# Altium schematic sheet Controller_Sheet.SchDoc
size A; SheetNumber: 3; SheetTotal: 3
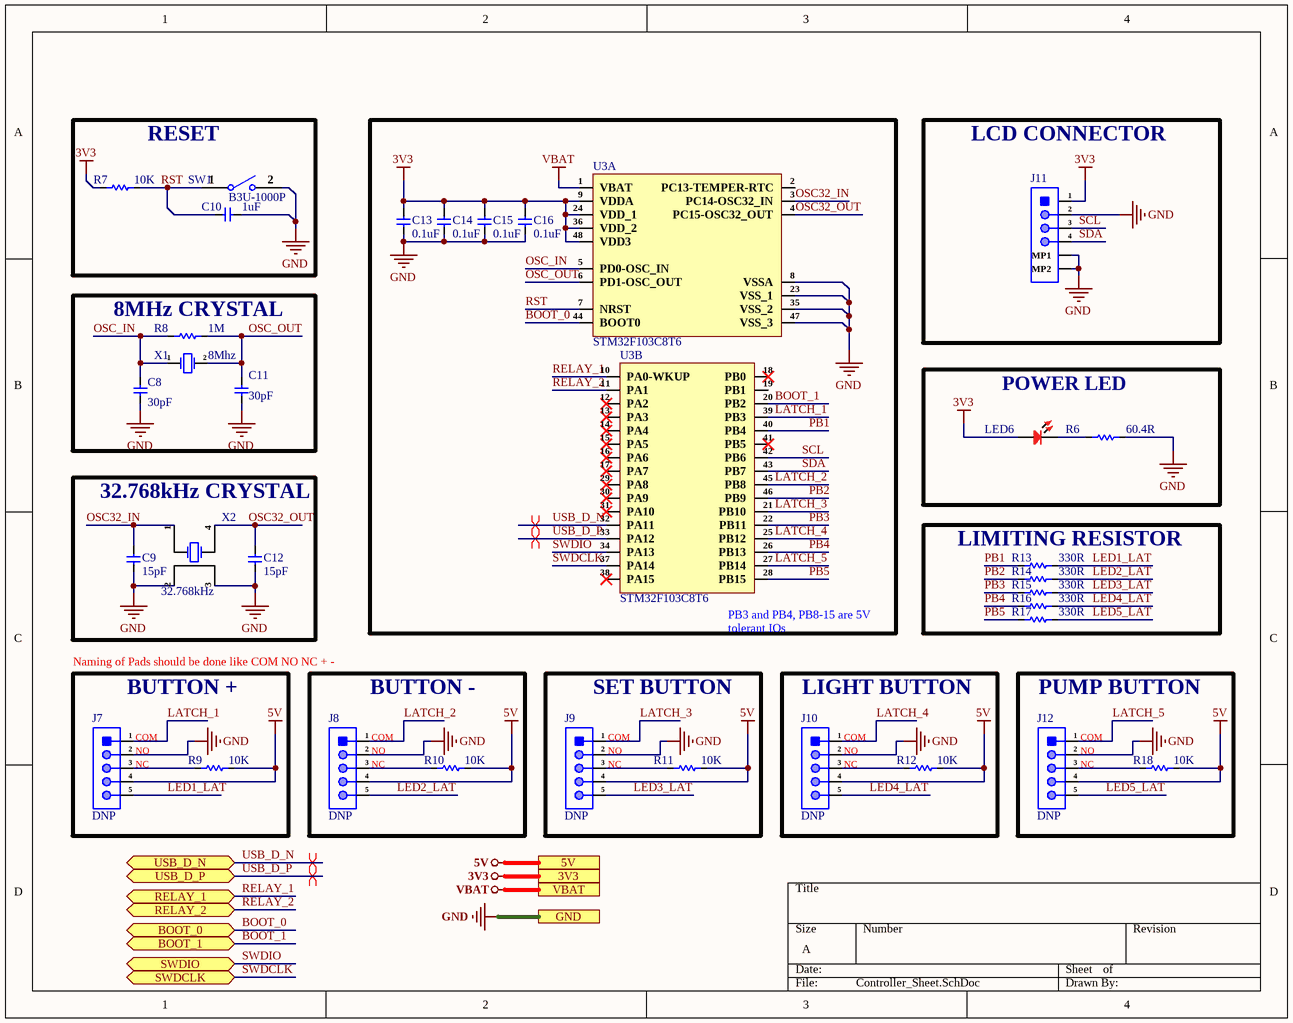
[diagram p0: Controller_Sheet.SchDoc]

## Parts
C8  30pF  [Cap-0603]
C9  15pF  [Cap-0603]
C10  1uF  [Cap-0603]
C11  30pF  [Cap-0603]
C12  15pF  [Cap-0603]
C13  0.1uF  [Cap-0603]
C14  0.1uF  [Cap-0603]
C15  0.1uF  [Cap-0603]
C16  0.1uF  [Cap-0603]
J7  DNP  [5P Through Hole Pads]
J8  DNP  [5P Through Hole Pads]
J9  DNP  [5P Through Hole Pads]
J10  DNP  [5P Through Hole Pads]
J11  WAFER-PH2.0-4PWB  [WAFER-PH2.0-4PWB]  (value not drawn)
J12  DNP  [5P Through Hole Pads]
LED6  RED  [LED-0603]  (value not drawn)
R6  60.4R  [Res-0603]
R7  10K  [Res-0603]
R8  1M  [Res-0603]
R9  10K  [Res-0603]
R10  10K  [Res-0603]
R11  10K  [Res-0603]
R12  10K  [Res-0603]
R13  330R  [Res-0603]
R14  330R  [Res-0603]
R15  330R  [Res-0603]
R16  330R  [Res-0603]
R17  330R  [Res-0603]
R18  10K  [Res-0603]
SW1  B3U-1000P  [B3U-1000P]
U3  STM32F103C8T6  [48-LQFP (7x7)_]  (parts A,B of 2)
X1  8Mhz  [71008000RW1]
X2  32.768kHz  [MC-306]

## Blocks framed on the sheet
RESET: C10 R7 SW1
LCD CONNECTOR: J11
8MHz CRYSTAL: C8 C11 R8 X1
POWER LED: LED6 R6
32.768kHz CRYSTAL: C9 C12 X2
LIMITING RESISTOR: R13-R17
BUTTON +: J7 R9
BUTTON -: J8 R10
SET BUTTON: J9 R11
LIGHT BUTTON: J10 R12
PUMP BUTTON: J12 R18

## Ports
3V3 (see Top_Sheet[3B], Power_Sheet[2D]), 5V (see Top_Sheet[3B], Power_Sheet[2D]), BOOT_0 (bidir, see Top_Sheet[3B], Power_Sheet[1D]), BOOT_1 (bidir, see Top_Sheet[3B], Power_Sheet[1D]), GND (see Top_Sheet[3C], Power_Sheet[2D]), RELAY_1 (bidir, see Top_Sheet[3B], Power_Sheet[1D]), RELAY_2 (bidir, see Top_Sheet[3B], Power_Sheet[1D]), SWDCLK (bidir, see Top_Sheet[3C], Power_Sheet[1D]), SWDIO (bidir, see Top_Sheet[3C], Power_Sheet[1D]), USB_D_N (bidir, see Top_Sheet[3B], Power_Sheet[1D]), USB_D_P (bidir, see Top_Sheet[3B], Power_Sheet[1D]), VBAT (see Top_Sheet[3B], Power_Sheet[2D])

## Nets
3V3: C13.2 C14.2 C15.2 C16.2 J11.1 LED6.1 R7.1 U3.9(VDDA) U3.24(VDD_1) U3.36(VDD_2) U3.48(VDD3) ; port 3V3
5V: J7.4 J8.4 J9.4 J10.4 J12.4 R9.2 R10.2 R11.2 R12.2 R18.2 ; port 5V
GND: C8.1 C9.1 C10.2 C11.1 C12.1 C13.1 C14.1 C15.1 C16.1 J7.2 J8.2 J9.2 J10.2 J11.2 J11.MP1 J11.MP2 J12.2 R6.2 SW1.2 U3.8(VSSA) U3.23(VSS_1) U3.35(VSS_2) U3.47(VSS_3) X2.2 X2.3 ; port GND
VBAT: U3.1(VBAT) ; port VBAT
BOOT_0: U3.44(BOOT0) ; port BOOT_0
BOOT_1: U3.20(PB2) ; port BOOT_1
LATCH_1: J7.1 U3.39(PB3)
LATCH_2: J8.1 U3.45(PB8)
LATCH_3: J9.1 U3.21(PB10)
LATCH_4: J10.1 U3.25(PB12)
LATCH_5: J12.1 U3.27(PB14)
LED1_LAT: J7.5 R13.2
LED2_LAT: J8.5 R14.2
LED3_LAT: J9.5 R15.2
LED4_LAT: J10.5 R16.2
LED5_LAT: J12.5 R17.2
OSC32_IN: C9.2 U3.3(PC14-OSC32_IN) X2.1(OSC1)
OSC32_OUT: C12.2 U3.4(PC15-OSC32_OUT) X2.4(OSC2)
OSC_IN: C8.2 R8.1 U3.5(PD0-OSC_IN) X1.1(OSC1)
OSC_OUT: C11.2 R8.2 U3.6(PD1-OSC_OUT) X1.2(OSC2)
PB1: R13.1 U3.40(PB4)
PB2: R14.1 U3.46(PB9)
PB3: R15.1 U3.22(PB11)
PB4: R16.1 U3.26(PB13)
PB5: R17.1 U3.28(PB15)
RELAY_1: U3.10(PA0-WKUP) ; port RELAY_1
RELAY_2: U3.11(PA1) ; port RELAY_2
RST: C10.1 R7.2 SW1.1 U3.7(NRST)
SCL: J11.3 U3.42(PB6)
SDA: J11.4 U3.43(PB7)
SWDCLK: U3.37(PA14) ; port SWDCLK
SWDIO: U3.34(PA13) ; port SWDIO
USB_D_N: U3.32(PA11) ; port USB_D_N
USB_D_P: U3.33(PA12) ; port USB_D_P
NetJ7_3: J7.3 R9.1
NetJ8_3: J8.3 R10.1
NetJ9_3: J9.3 R11.1
NetJ10_3: J10.3 R12.1
NetJ12_3: J12.3 R18.1
NetLED6_2: LED6.2 R6.1

Not connected (* = marked no-connect by the designer): U3 2(PC13-TEMPER-RTC) 12(PA2)* 13(PA3)* 14(PA4)* 15(PA5)* 16(PA6)* 17(PA7)* 18(PB0)* 19(PB1) 29(PA8)* 30(PA9)* 31(PA10)* 38(PA15)* 41(PB5)*

## Layout directives
differential pair; net class USB; differential pair class USB_Lines; rule Impedance Constraint [Min = 85.00    Max = 90.00    ]; rule Matched Net Lengths [Tolerance = 50mil]: USB_D_N, USB_D_P

## Notes on the sheet
- (near U3) PB3 and PB4, PB8-15 are 5V tolerant IOs
- Naming of Pads should be done like COM NO NC + -
- (near J7) +
- (near J7) COM
- (near J7) NO
- (near J7) NC
- (near J8) +
- (near J8) COM
- (near J8) NO
- (near J8) NC
- (near J9) +
- (near J9) COM
- (near J9) NO
- (near J9) NC
- (near J10) +
- (near J10) COM
- (near J10) NO
- (near J10) NC
- (near J12) +
- (near J12) COM
- (near J12) NO
- (near J12) NC
- (near J7) -
- (near J8) -
- (near J9) -
- (near J10) -
- (near J12) -

## Library data of the parts
C8 C11 = CC0603JRNPO9BN300: CAP 30pF NP0 0603 50 V ±5 % SMD; Manufacturer: Yageo; Tolerance: 5%; Dielectric: C0G; Voltage Rating: 50V; Dissipation Factor: 0.1%; Insulation Resistance: 10GR; Supplier 1: Digi-Key; Manufacturer Part Number: CC0603JRNPO9BN300; RoHS: Yes; Category: Ceramic Capacitors; Stock 1: 36700; Pricing 1: 1=0.10000, 10=0.06800, 50=0.03700, 100=0.03020, 500=0.02160, 1000=0.01697 (USD); Mount: Surface Mount; Case/Package: 0603; Number of Pins: 2; Case Code (Imperial): 0603; Case Code (Metric): 1608; Weight: 7.1E-05oz; Min Operating Temperature: -55°C; Max Operating Temperature: 125°C; Capacitance: 30pF; Packaging: Tape and Reel; Voltage Rating (DC): 50V; Termination: SMD/SMT; Resistor Type: Ceramic; Series: CC; Construction: Flat; Length: 1.6mm; Width: 0.031inch; Height: 0.8mm; Thickness: 0.035inch; Depth: 0.8mm; Radiation Hardening: No; REACH SVHC: No SVHC; Lead Free: Lead Free; RoHS Compliant: Yes; ComponentLink1URL: https://datasheet.ciiva.com/26862/getdatasheetpartid-403531-26862766.pdf?src-supplier=Verical; ComponentLink1Description: https://datasheet.ciiva.com/26862/getdatasheetpartid-403531-26862766.pdf?src-supplier=Verical; ComponentLink2URL: https://datasheet.ciiva.com/13264/upy-gp-np0-16v-to-50v-8-3714-13264406.pdf?src-supplier=Mouser; ComponentLink2Description: https://datasheet.ciiva.com/13264/upy-gp-np0-16v-to-50v-8-3714-13264406.pdf?src-supplier=Mouser; ComponentLink3URL: https://datasheet.ciiva.com/7978/1132289-7978140.pdf?src-supplier=Element14; ComponentLink3Description: https://datasheet.ciiva.com/7978/1132289-7978140.pdf?src-supplier=Element14; ComponentLink4URL: https://datasheet.ciiva.com/28450/1443161-28450494.pdf?src-supplier=Element14; ComponentLink4Description: https://datasheet.ciiva.com/28450/1443161-28450494.pdf?src-supplier=Element14; Supplier Part Number 1: 311-3357-1-ND; LCSC Part Number: C113797
C9 C12 = CC0603JRNPO9BN150: CAP CER 15PF 50V C0G/NPO 0603; Manufacturer: Yageo; Dielectric Material: Ceramic; Tolerance: 5%; Dielectric: C0G; Insulation Resistance: 100GR; Item Type: Capacitor; Supplier 1: Future Electronics; Manufacturer Part Number: CC0603JRNPO9BN150; RoHS: Yes; Category: Ceramic Capacitors; Stock 1: 832000; Pricing 1: 4000=0.0038, 16000=0.0036, 80000=0.0034, 160000=0.0033, 500000=0.0031 (USD); Mounting Technology: Surface Mount; Case/Package: 0603; Pins: 2; Case Code (Metric): 1608; Case Code (Imperial): 0603; Min Operating Temperature: -55°C; Max Operating Temperature: 125°C; Value: 15pF; Series: CC; Packaging: Tape and Reel; Package Quantity: 1; Termination: SMD/SMT; Voltage Rating: 50V; Length: 1.6mm; Width: 0.031inch; Height: 0.8mm; Depth: 0.8mm; Thickness: 0.035inch; Radiation Hardening: No; RoHS Compliant: Yes; Reach SVHC Compliant: No; Lead Free: Lead Free; ComponentLink1URL: https://datasheet.ciiva.com/144/mlccorderingcode-144635.pdf?src-supplier=Digi-Key; ComponentLink1Description: https://datasheet.ciiva.com/144/mlccorderingcode-144635.pdf?src-supplier=Digi-Key; ComponentLink2URL: https://datasheet.ciiva.com/144/mlccorderingcode-144636.pdf?src-supplier=Digi-Key; ComponentLink2Description: https://datasheet.ciiva.com/144/mlccorderingcode-144636.pdf?src-supplier=Digi-Key; ComponentLink3URL: https://datasheet.ciiva.com/8033/1443161-8033721.pdf?src-supplier=Element14; ComponentLink3Description: https://datasheet.ciiva.com/8033/1443161-8033721.pdf?src-supplier=Element14; ComponentLink4URL: https://datasheet.ciiva.com/28450/1443161-28450472.pdf?src-supplier=Element14; ComponentLink4Description: https://datasheet.ciiva.com/28450/1443161-28450472.pdf?src-supplier=Element14; ComponentLink5URL: https://datasheet.ciiva.com/144/mlccorderingcode-144634.pdf?src-supplier=Digi-Key; ComponentLink5Description: https://datasheet.ciiva.com/144/mlccorderingcode-144634.pdf?src-supplier=Digi-Key; ComponentLink6URL: https://datasheet.ciiva.com/8033/1734582-8033723.pdf?src-supplier=Element14; ComponentLink6Description: https://datasheet.ciiva.com/8033/1734582-8033723.pdf?src-supplier=Element14; ComponentLink7URL: https://datasheet.ciiva.com/8033/1734582-8033722.pdf?src-supplier=Element14; ComponentLink7Description: https://datasheet.ciiva.com/8033/1734582-8033722.pdf?src-supplier=Element14; ComponentLink8URL: https://datasheet.ciiva.com/11464/upy-gp-np0-16v-to-50v-8-11464727.pdf?src-supplier=Avnet; ComponentLink8Description: https://datasheet.ciiva.com/11464/upy-gp-np0-16v-to-50v-8-11464727.pdf?src-supplier=Avnet; Supplier Part Number 1: 4234670; LCSC Part Number: C107037
C10 = TCC0603X5R105M250CT: 1uF 25V X5R ±20% 0603 Multilayer Ceramic Capacitors MLCC - SMD/SMT ROHS; Manufacturer: CCTC; LCSC Part no: C6266891; Manufacturer Part no: TCC0603X5R105M250CT; Value: 1uF; Item Type: Capacitor
C13-C16 = CS0603KRX7R8BB104: CS Series 0603 0.1 uF 25 V ±10% X7R Multilayer Ceramic Capacitor; Manufacturer: Yageo; Supplier: Avnet; Supplier Part Number: 33AK6279; Manufacturer Part Number: CS0603KRX7R8BB104; RoHS: Yes; Category: Ceramic Capacitors; Stock: 3200; Pricing: 1=0.133, 25=0.092, 50=0.069, 100=0.047 (USD); ComponentLink1URL: https://www.yageo.com/upload/media/product/productsearch/datasheet/mlcc/UPY-ST_NPOX7R_16V-to-3KV_5.pdf?src-supplier=Digi-Key; ComponentLink1Description: https://www.yageo.com/upload/media/product/productsearch/datasheet/mlcc/UPY-ST_NPOX7R_16V-to-3KV_5.pdf?src-supplier=Digi-Key; ComponentLink2URL: https://datasheet.octopart.com/CS0603KRX7R8BB104-Yageo-datasheet-158410602.pdf?src-supplier=Future+Electronics; ComponentLink2Description: https://datasheet.octopart.com/CS0603KRX7R8BB104-Yageo-datasheet-158410602.pdf?src-supplier=Future+Electronics
J7-J10 J12 = 5P Through Hole Pads: Wire Connecting Pads; Manufacturer Part Number: 5P Through Hole Pads; Item Type: Through Hole Pads
J11 = WAFER-PH2.0-4PWB: 1x4P 1 2mm Male pin 4 -25℃~+85℃ 2A Surface Mount SMD,P=2mm Wire To Board / Wire To Wire Connector ROHS / C3029442; Manuacturer: XUNPU; Manufacturer Part no: WAFER-PH2.0-4PWB; LCSC Part no: C3029442; Item Type: Connector; ComponentLink1Description: LCSC; ComponentLink1URL: https://www.lcsc.com/product-detail/Wire-To-Board-Wire-To-Wire-Connector_XUNPU-WAFER-PH2-0-4PWB_C3029442.html
LED6 = XL-1608SURC-06: Colorless transparence -30℃~+85℃ Positive post 617nm~621nm Red 120° 55mW 0603 Light Emitting Diodes (LED) ROHS; Manufacturer: XINGLIGHT; Manufacturer Part no: XL-1608SURC-06; LCSC Part no: C965799; Package: 0603; Item Type: LED; ComponentLink1Description: LCSC; ComponentLink1URL: https://www.lcsc.com/product-detail/Light-Emitting-Diodes-LED_XINGLIGHT-XL-1608SURC-06_C965799.html
R6 = RTT0360R4FTP: 100mW Thick Film Resistors ±100ppm/℃ ±1% 60.4Ω 0603 Chip Resistor - Surface Mount ROHS; Manuacturer: RALEC; Manufacturer Part no: RTT0360R4FTP; Package: 0603; Value: 60.4R; LCSC Part no: C103744; ComponentLink1Description: LCSC; ComponentLink1URL: https://www.lcsc.com/product-detail/Chip-Resistor-Surface-Mount_RALEC-RTT0360R4FTP_C103744.html
R7 R9-R12 R18 = RC0603FR-0710KL: RES SMD 10K Ohm 1% 1/10W 0603; Manufacturer: Yageo; Resistance: 10kR; Temperature Coefficient: 100ppm/°C; Voltage Rating (DC): 50V; Power Rating: 100mW; Voltage Rating: 75V; Item Type: Resistor; Supplier 1: Digi-Key; Manufacturer Part Number: RC0603FR-0710KL; RoHS: Yes; Category: Chip SMD Resistors; Stock 1: 25249139; Pricing 1: 1=0.10000, 10=0.02400, 100=0.00970, 1000=0.00436, 2500=0.00378 (USD); Case/Package: 0603; Number of Pins: 2; Case Code (Imperial): 0603; Case Code (Metric): 1608; Weight: 7.1E-05oz; Size Code: 0603; Min Operating Temperature: -55°C; Max Operating Temperature: 155°C; Tolerance: 1%; Resistor Type: Thick Film; Packaging: Tape and Reel; Termination: SMD/SMT; Features: Moisture Resistant; Series: RC; Max Power Dissipation: 100mW; Number of Terminations: 2; Resistance Tolerance: 1%; Construction: Rectangular; Length: 1.6mm; Width: 0.8mm; Height: 0.45mm; Depth: 0.8mm; Lead Pitch: 0.3mm; REACH SVHC: Unknown; Lead Free: Lead Free; Military Standard: Not; RoHS Compliant: Yes; ComponentLink1URL: https://datasheet.ciiva.com/7660/38590-7660789.pdf?src-supplier=Element14; ComponentLink1Description: https://datasheet.ciiva.com/7660/38590-7660789.pdf?src-supplier=Element14; ComponentLink2URL: https://datasheet.ciiva.com/7983/443971-7983596.pdf?src-supplier=Element14; ComponentLink2Description: https://datasheet.ciiva.com/7983/443971-7983596.pdf?src-supplier=Element14; ComponentLink3URL: https://datasheet.ciiva.com/22747/443971-22747519.pdf?src-supplier=Element14; ComponentLink3Description: https://datasheet.ciiva.com/22747/443971-22747519.pdf?src-supplier=Element14; ComponentLink4URL: https://datasheet.ciiva.com/46440/1868787-46440891.pdf?src-supplier=Element14; ComponentLink4Description: https://datasheet.ciiva.com/46440/1868787-46440891.pdf?src-supplier=Element14; ComponentLink5URL: https://datasheet.ciiva.com/7746/1738695-7746239.pdf?src-supplier=Element14; ComponentLink5Description: https://datasheet.ciiva.com/7746/1738695-7746239.pdf?src-supplier=Element14; ComponentLink6URL: https://datasheet.ciiva.com/15189/getdatasheetpartid-409289-15189591.pdf?src-supplier=Verical; ComponentLink6Description: https://datasheet.ciiva.com/15189/getdatasheetpartid-409289-15189591.pdf?src-supplier=Verical; Supplier Part Number 1: 311-10.0KHRCT-ND; LCSC Part Number: C98220
R8 = 0603WAF1004T5E: 100mW Thick Film Resistors ±100ppm/℃ ±1% 1MΩ 0603 Chip Resistor - Surface Mount ROHS; Manufacturer: UNI-ROYAL(Uniroyal Elec); Manfacturer Part No: 0603WAF1004T5E; LCSC Part no: C22935; Package: 0603; Item Type: Resistor
R13-R17 = RC0603JR-07330RL_1: RES  SMD 330R 100 mW 0603; Manufacturer: Yageo; Power Rating: 100mW; Tolerance: 5%; Voltage Rating (DC): 50V; Temperature Coefficient: 100ppm/°C; Item Type: Resistor; Supplier 1: Digi-Key; Manufacturer Part Number: RC0603JR-07330RL; RoHS: Yes; Category: Chip SMD Resistors; Stock 1: 1074593; Pricing 1: 1=0.10000, 10=0.02000, 100=0.00800, 1000=0.00360, 2500=0.00312 (USD); Case/Package: 0603; Number of Pins: 2; Case Code (Imperial): 0603; Case Code (Metric): 1608; Size Code: 0603; Min Operating Temperature: -55°C; Max Operating Temperature: 155°C; Resistance: 330R; Packaging: Tape and Reel; Voltage Rating: 50V; Package Quantity: 5000; Termination: SMD/SMT; Resistor Type: Thick Film; Features: Moisture Resistant; Series: RC; Max Power Dissipation: 100mW; Number of Terminations: 2; Resistance Tolerance: 5%; Construction: Rectangular; Length: 1.6mm; Width: 0.8mm; Height: 0.45mm; Depth: 0.8mm; REACH SVHC: No SVHC; Lead Free: Lead Free; Military Standard: Not; RoHS Compliant: Yes; Supplier Part Number 1: 311-330GRCT-ND; LCSC Part Number: C105879
SW1 = B3U-1000P: SWITCH TACTILE SPST-NO 0.05A 12V; Manufacturer: Omron; Mechanical Life: 200000Cycles; Operating Force: 1.5N; Throw Configuration: SPST; Current Rating: 50mA; Contact Resistance: 100mR; Illumination Type: Non-Illuminated,Illuminated; Switch Travel: 0.15mm; Switch Function: Off-Mom; Actuator Type: Standard; Actuator Length: 0.4mm; Ratings: Dust Proof,IP40; ComponentLink1URL: http://www.farnell.com/datasheets/60838.pdf?src-supplier=Farnell; ComponentLink1Description: http://www.farnell.com/datasheets/60838.pdf?src-supplier=Farnell; ComponentLink2URL: http://www.farnell.com/datasheets/60838.pdf?src-supplier=Element14; ComponentLink2Description: http://www.farnell.com/datasheets/60838.pdf?src-supplier=Element14; ComponentLink3URL: https://omronfs.omron.com/en_US/ecb/products/pdf/en-b3u.pdf?src-supplier=Digi-Key; ComponentLink3Description: https://omronfs.omron.com/en_US/ecb/products/pdf/en-b3u.pdf?src-supplier=Digi-Key; ComponentLink4URL: http://www.omron.com/ecb/products/pdf/en-b3u.pdf?src-supplier=Digi-Key; ComponentLink4Description: http://www.omron.com/ecb/products/pdf/en-b3u.pdf?src-supplier=Digi-Key; ComponentLink5URL: https://www.distrelec.biz/Web/Downloads/he/et/B3U_eng_datasheet.pdf?mime=application%2Fpdf&src-supplier=Distrelec; ComponentLink5Description: https://www.distrelec.biz/Web/Downloads/he/et/B3U_eng_datasheet.pdf?mime=application%2Fpdf&src-supplier=Distrelec; ComponentLink6URL: http://www.onlinecomponents.com/productFiles/mf-OM/en-b3u.pdf?src-supplier=Onlinecomponents.com; ComponentLink6Description: http://www.onlinecomponents.com/productFiles/mf-OM/en-b3u.pdf?src-supplier=Onlinecomponents.com; Supplier 1: Digi-Key; Manufacturer Part Number: B3U-1000P; Stock 1: 116454; Pricing 1: 1=1, 10=0.961, 25=0.9064, 50=0.7976, 100=0.7251, 250=0.68888, 500=0.67074, 1000=0.52571 (USD); Mount: Surface Mount; Weight: 0.000776oz; Contact Material: Silver; Min Operating Temperature: -25°C; Max Operating Temperature: 70°C; Packaging: Tape and Reel; Voltage Rating (DC): 12V; Package Quantity: 1; Max Current Rating: 50mA; Termination: SMD/SMT; Orientation: Straight; Max Voltage Rating (DC): 12V; Electrical Life: 200000Cycles; Insulation Resistance: 100MR; Contact Current Rating: 50mA; Length: 4mm; Height: 1.2mm; Depth: 2.5mm; Width: 3mm; REACH SVHC: Unknown; Lead Free: Lead Free; ComponentLink7URL: https://www.verical.com/server-webapp/html/getDatasheet?partID=552554&src-supplier=Verical; ComponentLink7Description: https://www.verical.com/server-webapp/html/getDatasheet?partID=552554&src-supplier=Verical; ComponentLink8URL: http://www.farnell.com/datasheets/1685550.pdf?src-supplier=Element14; ComponentLink8Description: http://www.farnell.com/datasheets/1685550.pdf?src-supplier=Element14; ComponentLink9URL: http://www.farnell.com/datasheets/2610940.pdf?src-supplier=Farnell; ComponentLink9Description: http://www.farnell.com/datasheets/2610940.pdf?src-supplier=Farnell; ComponentLink10URL: https://www.alliedelec.com/m/d/4c8a9ef82804fc3c241a13c1e298fd73.pdf?src-supplier=Allied+Electronics; ComponentLink10Description: https://www.alliedelec.com/m/d/4c8a9ef82804fc3c241a13c1e298fd73.pdf?src-supplier=Allied+Electronics; Supplier Part Number 1: SW1020DKR-ND; LCSC Part Number: C231329; Item Type: Switch
U3 = STM32F103C8T6: ARM Cortex-M3 STM32 F1 Microcontroller 32-Bit 72MHz 64kB FLASH LQFP48 STM32F103C8T6; Manufacturer: STMicroelectronics; RAM Size: 20KB; Interface: I2C,SPI,USB,CAN,USART; Number of I/Os: 37; Number of Timers/Counters: 3; Max Supply Voltage: 3.6V; Number of ADC Channels: 10; Min Supply Voltage: 2V; Data Bus Width: 32b; Nominal Supply Current: 1.7uA; Number of A/D Converters: 2NUMBER; Number of Channels: 10NUMBER; Supplier: Mouser; Supplier Part Number: 511-STM32F103C8T6; Manufacturer Part Number: STM32F103C8T6; RoHS: Yes; Category: Microcontrollers; Stock: 27404; Pricing: 1=6.11, 10=5.53, 50=5.27, 100=4.58, 1000=3.47, 10000=3.33 (USD); Case/Package: LQFP; Pins: 48; Weight: 0.006349oz; Min Operating Temperature: -40°C; Max Operating Temperature: 85°C; Packaging: Tray; Package Quantity: 1500; Memory Format: FLASH; Clock Frequency: 72MHz; Memory Size: 64KB; Core Architecture: ARM; Series: STM32F103C8; Length: 7mm; Width: 7mm; Height: 1.4mm; Lead Free: Lead Free; RoHS Compliant: Yes; ComponentLink1URL: https://datasheet.ciiva.com/8054/1730126-8054942.pdf?src-supplier=Element14; ComponentLink1Description: https://datasheet.ciiva.com/8054/1730126-8054942.pdf?src-supplier=Element14; ComponentLink2URL: https://datasheet.ciiva.com/48687/001075658-da-01-en-mcu-64kb-mem-stm32f103c8t6-lqfp-48-stm-48687589.pdf?src-supplier=Conrad; ComponentLink2Description: https://datasheet.ciiva.com/48687/001075658-da-01-en-mcu-64kb-mem-stm32f103c8t6-lqfp-48-stm-48687589.pdf?src-supplier=Conrad
X1 = 71008000RW1: 8MHz 20pF ±20ppm HC-49S Crystals ROHS; Manufacture: HD; Manufacture Part ni:: 71008000RW1; LCSC Part no: C655216; Package: HC-49S; Item Type: Crystal; ComponentLink1Description: LCSC; ComponentLink1URL: https://www.lcsc.com/product-detail/Crystals_HD-71008000RW1_C655216.html
X2 = MC-306 32.7680K-A0:ROHS: 32.768kHz 12.5pF ±20ppm MC-306 Crystals ROHS; Manufacturer: Seiko Epson; Value: 32.786kHz; Manufacturer Part no: MC-306 32.7680K-A0:ROHS; Item Type: Crystal; LCSC Part no: C2650464; ComponentLink1Description: LCSC; ComponentLink1URL: https://www.lcsc.com/product-detail/Crystals_Seiko-Epson-MC-306-32-7680K-A0-ROHS_C2650464.html